# Altium schematic sheet Top-Sheet.SchDoc
size 420 x 297 mm; SheetNumber: 1; SheetTotal: 12
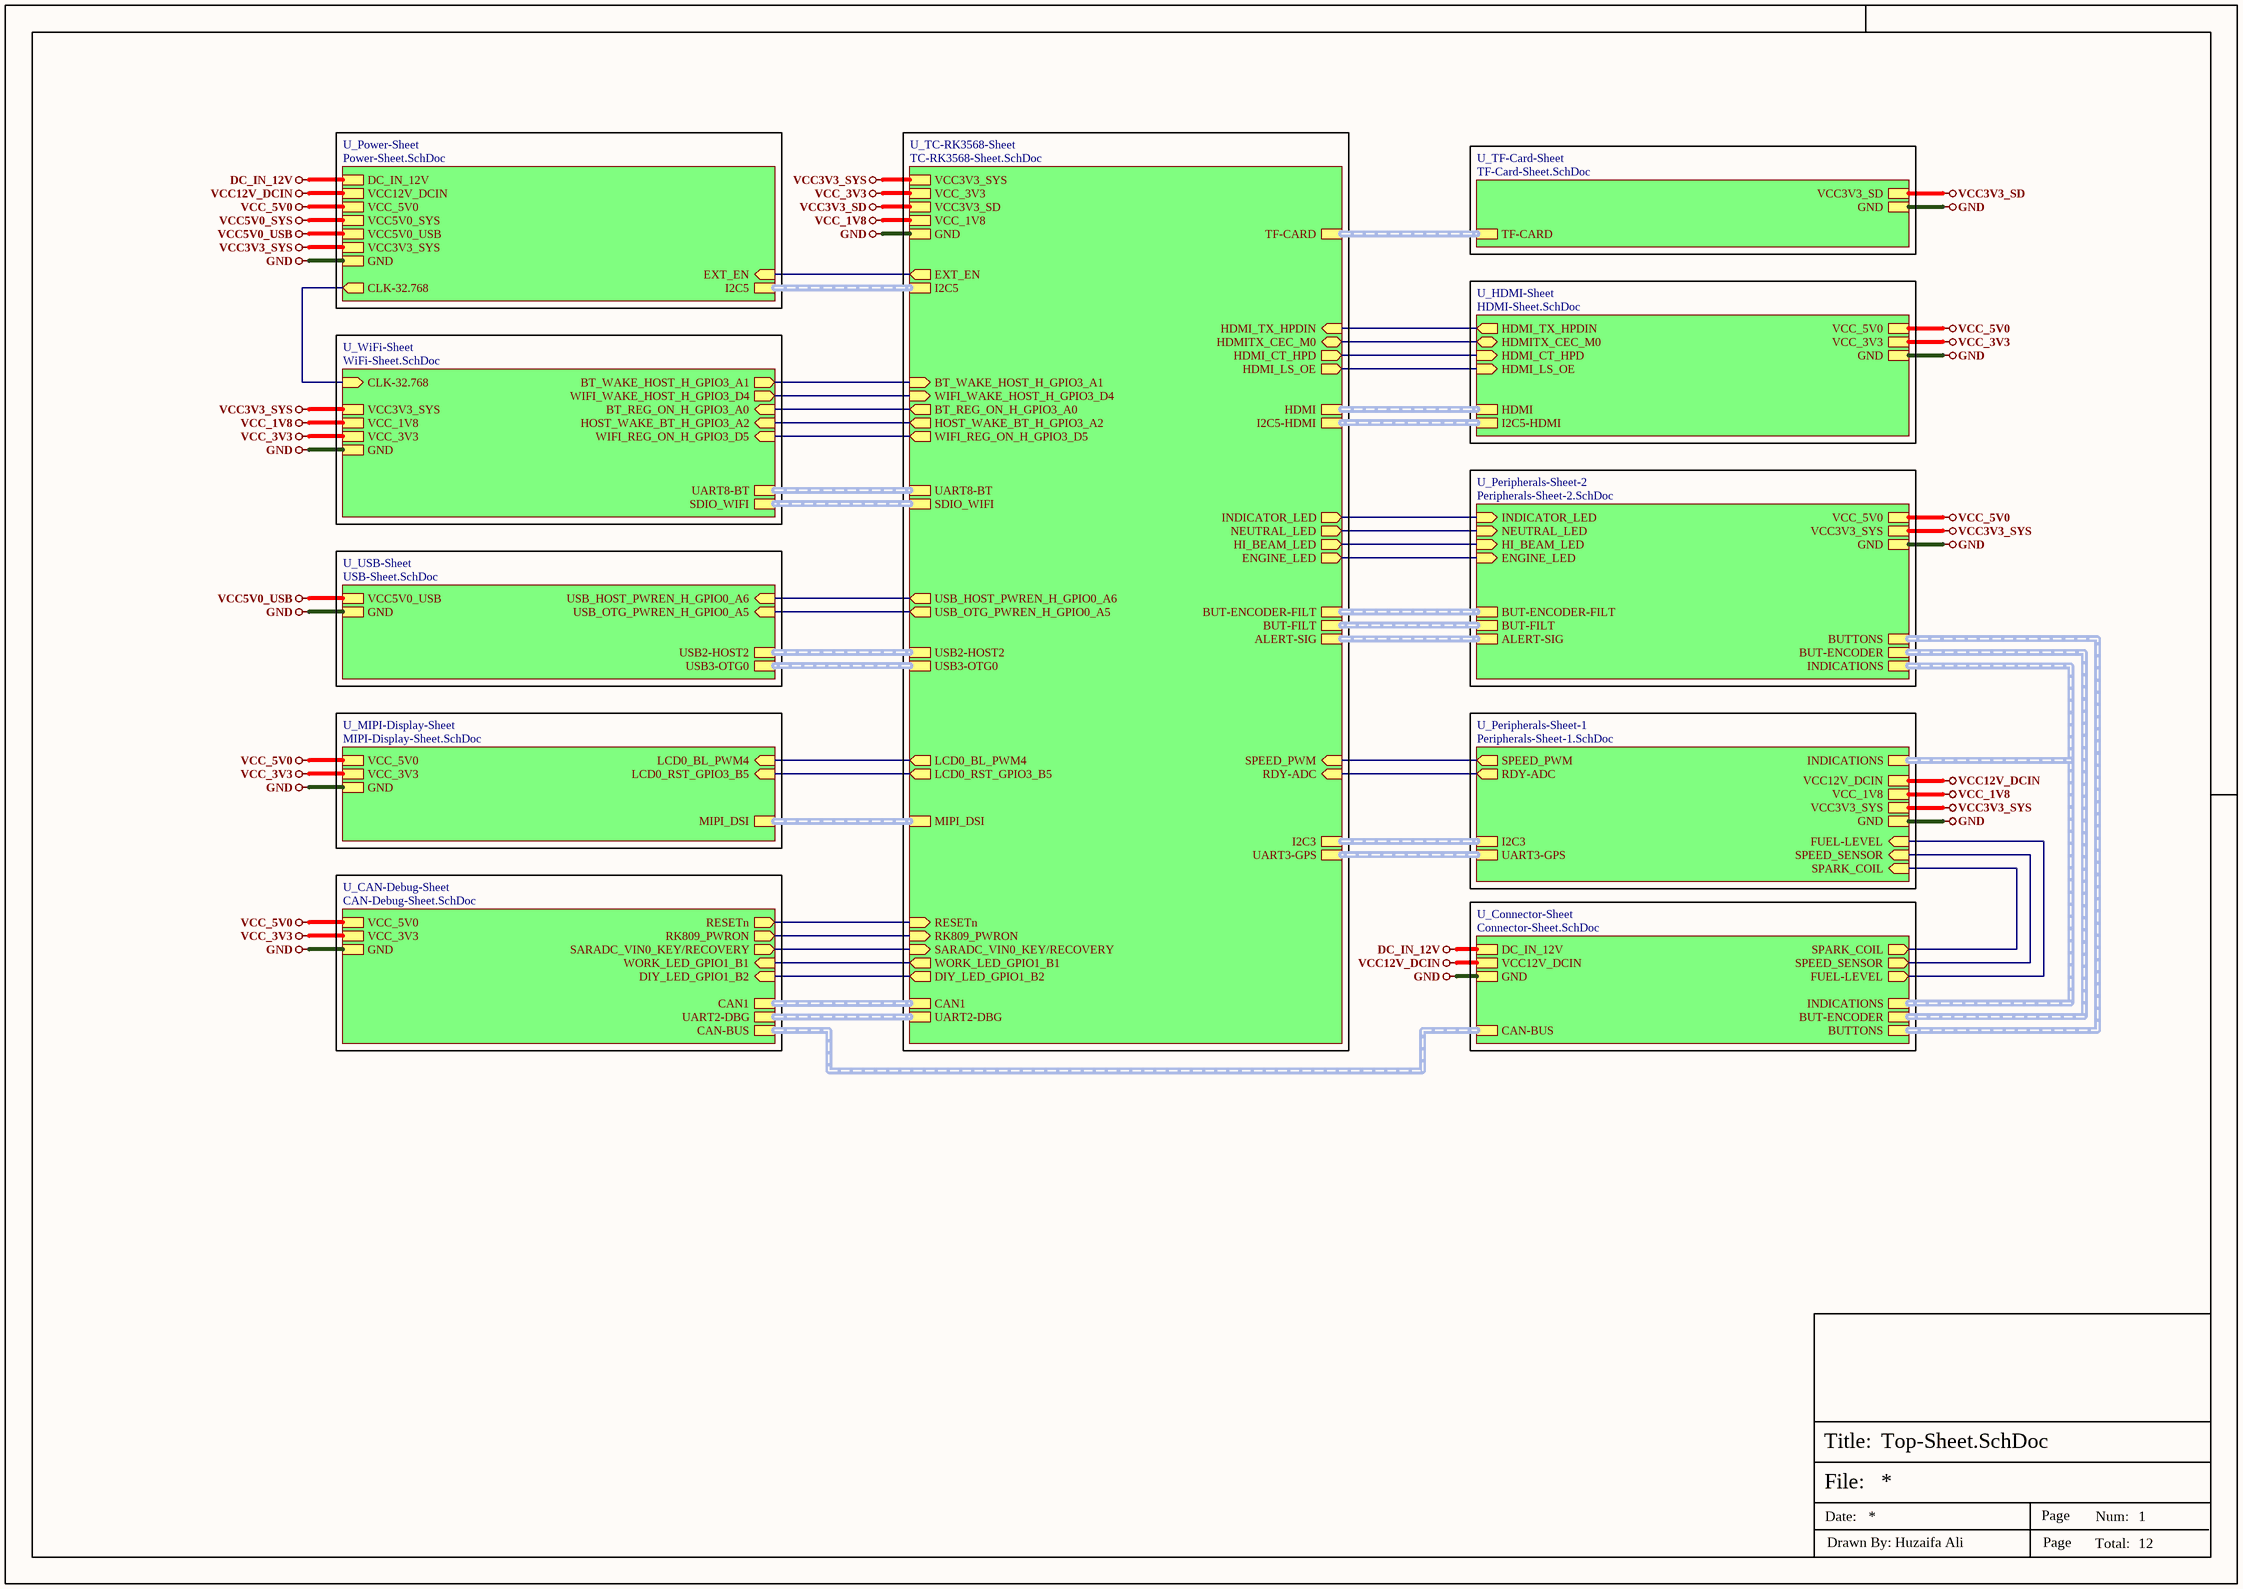
[diagram p0: Top-Sheet.SchDoc]

## Sub-sheets
U_CAN-Debug-Sheet = CAN-Debug-Sheet.SchDoc: WORK_LED_GPIO1_B1 (in), DIY_LED_GPIO1_B2 (in), RESETn (out), RK809_PWRON (out), SARADC_VIN0_KEY/RECOVERY (out), CAN1 (harness CAN1), UART2-DBG (harness UART2-DBG), CAN-BUS (harness CAN-BUS), GND, VCC_3V3, VCC_5V0
U_Connector-Sheet = Connector-Sheet.SchDoc: BUTTONS (harness BUTTONS), FUEL-LEVEL (out), DC_IN_12V, GND, SPARK_COIL (out), SPEED_SENSOR (out), INDICATIONS (harness INDICATIONS), CAN-BUS (harness CAN-BUS), BUT-ENCODER (harness BUT-ENCODER), VCC12V_DCIN
U_HDMI-Sheet = HDMI-Sheet.SchDoc: HDMI (harness HDMI), I2C5-HDMI (harness I2C5-HDMI), HDMITX_CEC_M0 (bidir), HDMI_TX_HPDIN (out), HDMI_CT_HPD (in), HDMI_LS_OE (in), GND, VCC_3V3, VCC_5V0
U_MIPI-Display-Sheet = MIPI-Display-Sheet.SchDoc: MIPI_DSI (harness MIPI_DSI), LCD0_BL_PWM4 (in), LCD0_RST_GPIO3_B5 (in), GND, VCC_5V0, VCC_3V3
U_Peripherals-Sheet-1 = Peripherals-Sheet-1.SchDoc: RDY-ADC (out), SPEED_PWM (out), UART3-GPS (harness UART3-GPS), I2C3 (harness I2C3), INDICATIONS (harness INDICATIONS), FUEL-LEVEL (in), SPARK_COIL (in), SPEED_SENSOR (in), VCC12V_DCIN, GND, VCC3V3_SYS, VCC_1V8
U_Peripherals-Sheet-2 = Peripherals-Sheet-2.SchDoc: INDICATOR_LED (in), NEUTRAL_LED (in), HI_BEAM_LED (in), ENGINE_LED (in), INDICATIONS (harness INDICATIONS), BUTTONS (harness BUTTONS), BUT-ENCODER (harness BUT-ENCODER), BUT-FILT (harness BUT-FILT), ALERT-SIG (harness ALERT-SIG), GND, VCC_5V0, VCC3V3_SYS, BUT-ENCODER-FILT (harness BUT-ENCODER)
U_Power-Sheet = Power-Sheet.SchDoc: EXT_EN (in), I2C5 (harness I2C5), CLK-32.768 (out), DC_IN_12V, GND, VCC12V_DCIN, VCC_5V0, VCC5V0_SYS, VCC5V0_USB, VCC3V3_SYS
U_TC-RK3568-Sheet = TC-RK3568-Sheet.SchDoc: TF-CARD (harness TF-CARD), RESETn (in), RK809_PWRON (in), SARADC_VIN0_KEY/RECOVERY (in), EXT_EN (out), I2C5 (harness I2C5), SPEED_PWM (in), CAN1 (harness CAN1), UART2-DBG (harness UART2-DBG), UART3-GPS (harness UART3-GPS), HOST_WAKE_BT_H_GPIO3_A2 (out), BT_WAKE_HOST_H_GPIO3_A1 (in), BT_REG_ON_H_GPIO3_A0 (out), UART8-BT (harness UART8-BT), WIFI_REG_ON_H_GPIO3_D5 (out), WIFI_WAKE_HOST_H_GPIO3_D4 (in), SDIO_WIFI (harness SDIO_WIFI), USB2-HOST2 (harness USB2-HOST2), MIPI_DSI (harness MIPI_DSI), HDMI (harness HDMI), I2C5-HDMI (harness I2C5-HDMI), HDMITX_CEC_M0 (bidir), HDMI_TX_HPDIN (in), USB3-OTG0 (harness USB3-OTG0), USB_HOST_PWREN_H_GPIO0_A6 (out), USB_OTG_PWREN_H_GPIO0_A5 (out), I2C3 (harness I2C3), DIY_LED_GPIO1_B2 (out), WORK_LED_GPIO1_B1 (out), INDICATOR_LED (out), NEUTRAL_LED (out), HI_BEAM_LED (out), ENGINE_LED (out), HDMI_CT_HPD (out), HDMI_LS_OE (out), LCD0_BL_PWM4 (out), LCD0_RST_GPIO3_B5 (out), BUT-ENCODER-FILT (harness BUT-ENCODER), BUT-FILT (harness BUT-FILT), ALERT-SIG (harness ALERT-SIG), VCC3V3_SD, GND, VCC_3V3, VCC_1V8, RDY-ADC (in), VCC3V3_SYS
U_TF-Card-Sheet = TF-Card-Sheet.SchDoc: TF-CARD (harness TF-CARD), VCC3V3_SD, GND
U_USB-Sheet = USB-Sheet.SchDoc: USB_HOST_PWREN_H_GPIO0_A6 (in), USB_OTG_PWREN_H_GPIO0_A5 (in), USB2-HOST2 (harness USB2-HOST2), USB3-OTG0 (harness USB3-OTG0), GND, VCC5V0_USB
U_WiFi-Sheet = WiFi-Sheet.SchDoc: BT_REG_ON_H_GPIO3_A0 (in), HOST_WAKE_BT_H_GPIO3_A2 (in), BT_WAKE_HOST_H_GPIO3_A1 (out), WIFI_REG_ON_H_GPIO3_D5 (in), WIFI_WAKE_HOST_H_GPIO3_D4 (out), UART8-BT (harness UART8-BT), SDIO_WIFI (harness SDIO_WIFI), CLK-32.768 (in), GND, VCC_1V8, VCC_3V3, VCC3V3_SYS

## Nets
DC_IN_12V: sheet U_Power-Sheet/DC_IN_12V, sheet U_Connector-Sheet/DC_IN_12V
GND: sheet U_TC-RK3568-Sheet/GND, sheet U_Power-Sheet/GND, sheet U_WiFi-Sheet/GND, sheet U_USB-Sheet/GND, sheet U_TF-Card-Sheet/GND, sheet U_HDMI-Sheet/GND, sheet U_MIPI-Display-Sheet/GND, sheet U_CAN-Debug-Sheet/GND, sheet U_Peripherals-Sheet-1/GND, sheet U_Peripherals-Sheet-2/GND, sheet U_Connector-Sheet/GND
VCC3V3_SD: sheet U_TC-RK3568-Sheet/VCC3V3_SD, sheet U_TF-Card-Sheet/VCC3V3_SD
VCC3V3_SYS: sheet U_TC-RK3568-Sheet/VCC3V3_SYS, sheet U_Power-Sheet/VCC3V3_SYS, sheet U_WiFi-Sheet/VCC3V3_SYS, sheet U_Peripherals-Sheet-1/VCC3V3_SYS, sheet U_Peripherals-Sheet-2/VCC3V3_SYS
VCC5V0_SYS: sheet U_Power-Sheet/VCC5V0_SYS
VCC5V0_USB: sheet U_Power-Sheet/VCC5V0_USB, sheet U_USB-Sheet/VCC5V0_USB
VCC12V_DCIN: sheet U_Power-Sheet/VCC12V_DCIN, sheet U_Peripherals-Sheet-1/VCC12V_DCIN, sheet U_Connector-Sheet/VCC12V_DCIN
VCC_1V8: sheet U_TC-RK3568-Sheet/VCC_1V8, sheet U_WiFi-Sheet/VCC_1V8, sheet U_Peripherals-Sheet-1/VCC_1V8
VCC_3V3: sheet U_TC-RK3568-Sheet/VCC_3V3, sheet U_WiFi-Sheet/VCC_3V3, sheet U_HDMI-Sheet/VCC_3V3, sheet U_MIPI-Display-Sheet/VCC_3V3, sheet U_CAN-Debug-Sheet/VCC_3V3
VCC_5V0: sheet U_Power-Sheet/VCC_5V0, sheet U_HDMI-Sheet/VCC_5V0, sheet U_MIPI-Display-Sheet/VCC_5V0, sheet U_CAN-Debug-Sheet/VCC_5V0, sheet U_Peripherals-Sheet-2/VCC_5V0
(unnamed): sheet U_TC-RK3568-Sheet/RESETn, sheet U_CAN-Debug-Sheet/RESETn
(unnamed): sheet U_TC-RK3568-Sheet/RK809_PWRON, sheet U_CAN-Debug-Sheet/RK809_PWRON
(unnamed): sheet U_TC-RK3568-Sheet/SARADC_VIN0_KEY/RECOVERY, sheet U_CAN-Debug-Sheet/SARADC_VIN0_KEY/RECOVERY
(unnamed): sheet U_TC-RK3568-Sheet/EXT_EN, sheet U_Power-Sheet/EXT_EN
(unnamed): sheet U_TC-RK3568-Sheet/SPEED_PWM, sheet U_Peripherals-Sheet-1/SPEED_PWM
(unnamed): sheet U_TC-RK3568-Sheet/HOST_WAKE_BT_H_GPIO3_A2, sheet U_WiFi-Sheet/HOST_WAKE_BT_H_GPIO3_A2
(unnamed): sheet U_TC-RK3568-Sheet/BT_WAKE_HOST_H_GPIO3_A1, sheet U_WiFi-Sheet/BT_WAKE_HOST_H_GPIO3_A1
(unnamed): sheet U_TC-RK3568-Sheet/BT_REG_ON_H_GPIO3_A0, sheet U_WiFi-Sheet/BT_REG_ON_H_GPIO3_A0
(unnamed): sheet U_TC-RK3568-Sheet/WIFI_REG_ON_H_GPIO3_D5, sheet U_WiFi-Sheet/WIFI_REG_ON_H_GPIO3_D5
(unnamed): sheet U_TC-RK3568-Sheet/WIFI_WAKE_HOST_H_GPIO3_D4, sheet U_WiFi-Sheet/WIFI_WAKE_HOST_H_GPIO3_D4
(unnamed): sheet U_TC-RK3568-Sheet/HDMITX_CEC_M0, sheet U_HDMI-Sheet/HDMITX_CEC_M0
(unnamed): sheet U_TC-RK3568-Sheet/HDMI_TX_HPDIN, sheet U_HDMI-Sheet/HDMI_TX_HPDIN
(unnamed): sheet U_TC-RK3568-Sheet/USB_HOST_PWREN_H_GPIO0_A6, sheet U_USB-Sheet/USB_HOST_PWREN_H_GPIO0_A6
(unnamed): sheet U_TC-RK3568-Sheet/USB_OTG_PWREN_H_GPIO0_A5, sheet U_USB-Sheet/USB_OTG_PWREN_H_GPIO0_A5
(unnamed): sheet U_TC-RK3568-Sheet/DIY_LED_GPIO1_B2, sheet U_CAN-Debug-Sheet/DIY_LED_GPIO1_B2
(unnamed): sheet U_TC-RK3568-Sheet/WORK_LED_GPIO1_B1, sheet U_CAN-Debug-Sheet/WORK_LED_GPIO1_B1
(unnamed): sheet U_TC-RK3568-Sheet/INDICATOR_LED, sheet U_Peripherals-Sheet-2/INDICATOR_LED
(unnamed): sheet U_TC-RK3568-Sheet/NEUTRAL_LED, sheet U_Peripherals-Sheet-2/NEUTRAL_LED
(unnamed): sheet U_TC-RK3568-Sheet/HI_BEAM_LED, sheet U_Peripherals-Sheet-2/HI_BEAM_LED
(unnamed): sheet U_TC-RK3568-Sheet/ENGINE_LED, sheet U_Peripherals-Sheet-2/ENGINE_LED
(unnamed): sheet U_TC-RK3568-Sheet/HDMI_CT_HPD, sheet U_HDMI-Sheet/HDMI_CT_HPD
(unnamed): sheet U_TC-RK3568-Sheet/HDMI_LS_OE, sheet U_HDMI-Sheet/HDMI_LS_OE
(unnamed): sheet U_TC-RK3568-Sheet/LCD0_BL_PWM4, sheet U_MIPI-Display-Sheet/LCD0_BL_PWM4
(unnamed): sheet U_TC-RK3568-Sheet/LCD0_RST_GPIO3_B5, sheet U_MIPI-Display-Sheet/LCD0_RST_GPIO3_B5
(unnamed): sheet U_TC-RK3568-Sheet/RDY-ADC, sheet U_Peripherals-Sheet-1/RDY-ADC
(unnamed): sheet U_Power-Sheet/CLK-32.768, sheet U_WiFi-Sheet/CLK-32.768
(unnamed): sheet U_Peripherals-Sheet-1/FUEL-LEVEL, sheet U_Connector-Sheet/FUEL-LEVEL
(unnamed): sheet U_Peripherals-Sheet-1/SPARK_COIL, sheet U_Connector-Sheet/SPARK_COIL
(unnamed): sheet U_Peripherals-Sheet-1/SPEED_SENSOR, sheet U_Connector-Sheet/SPEED_SENSOR

## Buses and harness runs
harness sheet U_CAN-Debug-Sheet/CAN1 = sheet U_TC-RK3568-Sheet/CAN1
harness sheet U_CAN-Debug-Sheet/CAN-BUS = sheet U_Connector-Sheet/CAN-BUS
harness sheet U_CAN-Debug-Sheet/UART2-DBG = sheet U_TC-RK3568-Sheet/UART2-DBG
harness sheet U_Connector-Sheet/BUT-ENCODER = sheet U_Peripherals-Sheet-2/BUT-ENCODER
harness sheet U_Connector-Sheet/BUTTONS = sheet U_Peripherals-Sheet-2/BUTTONS
harness sheet U_Connector-Sheet/INDICATIONS = sheet U_Peripherals-Sheet-1/INDICATIONS = sheet U_Peripherals-Sheet-2/INDICATIONS
harness sheet U_HDMI-Sheet/HDMI = sheet U_TC-RK3568-Sheet/HDMI
harness sheet U_HDMI-Sheet/I2C5-HDMI = sheet U_TC-RK3568-Sheet/I2C5-HDMI
harness sheet U_MIPI-Display-Sheet/MIPI_DSI = sheet U_TC-RK3568-Sheet/MIPI_DSI
harness sheet U_Peripherals-Sheet-1/I2C3 = sheet U_TC-RK3568-Sheet/I2C3
harness sheet U_Peripherals-Sheet-1/UART3-GPS = sheet U_TC-RK3568-Sheet/UART3-GPS
harness sheet U_Peripherals-Sheet-2/ALERT-SIG = sheet U_TC-RK3568-Sheet/ALERT-SIG
harness sheet U_Peripherals-Sheet-2/BUT-ENCODER-FILT = sheet U_TC-RK3568-Sheet/BUT-ENCODER-FILT
harness sheet U_Peripherals-Sheet-2/BUT-FILT = sheet U_TC-RK3568-Sheet/BUT-FILT
harness sheet U_Power-Sheet/I2C5 = sheet U_TC-RK3568-Sheet/I2C5
harness sheet U_TC-RK3568-Sheet/SDIO_WIFI = sheet U_WiFi-Sheet/SDIO_WIFI
harness sheet U_TC-RK3568-Sheet/TF-CARD = sheet U_TF-Card-Sheet/TF-CARD
harness sheet U_TC-RK3568-Sheet/UART8-BT = sheet U_WiFi-Sheet/UART8-BT
harness sheet U_TC-RK3568-Sheet/USB2-HOST2 = sheet U_USB-Sheet/USB2-HOST2
harness sheet U_TC-RK3568-Sheet/USB3-OTG0 = sheet U_USB-Sheet/USB3-OTG0

## Notes on the sheet
- File:
- Title:
- Date:
- Page
- Num:
- Total:
- Drawn By: Huzaifa Ali